# Altium schematic sheet DFMM_2024.SchDoc
size A3; SheetNumber: 1; SheetTotal: 3
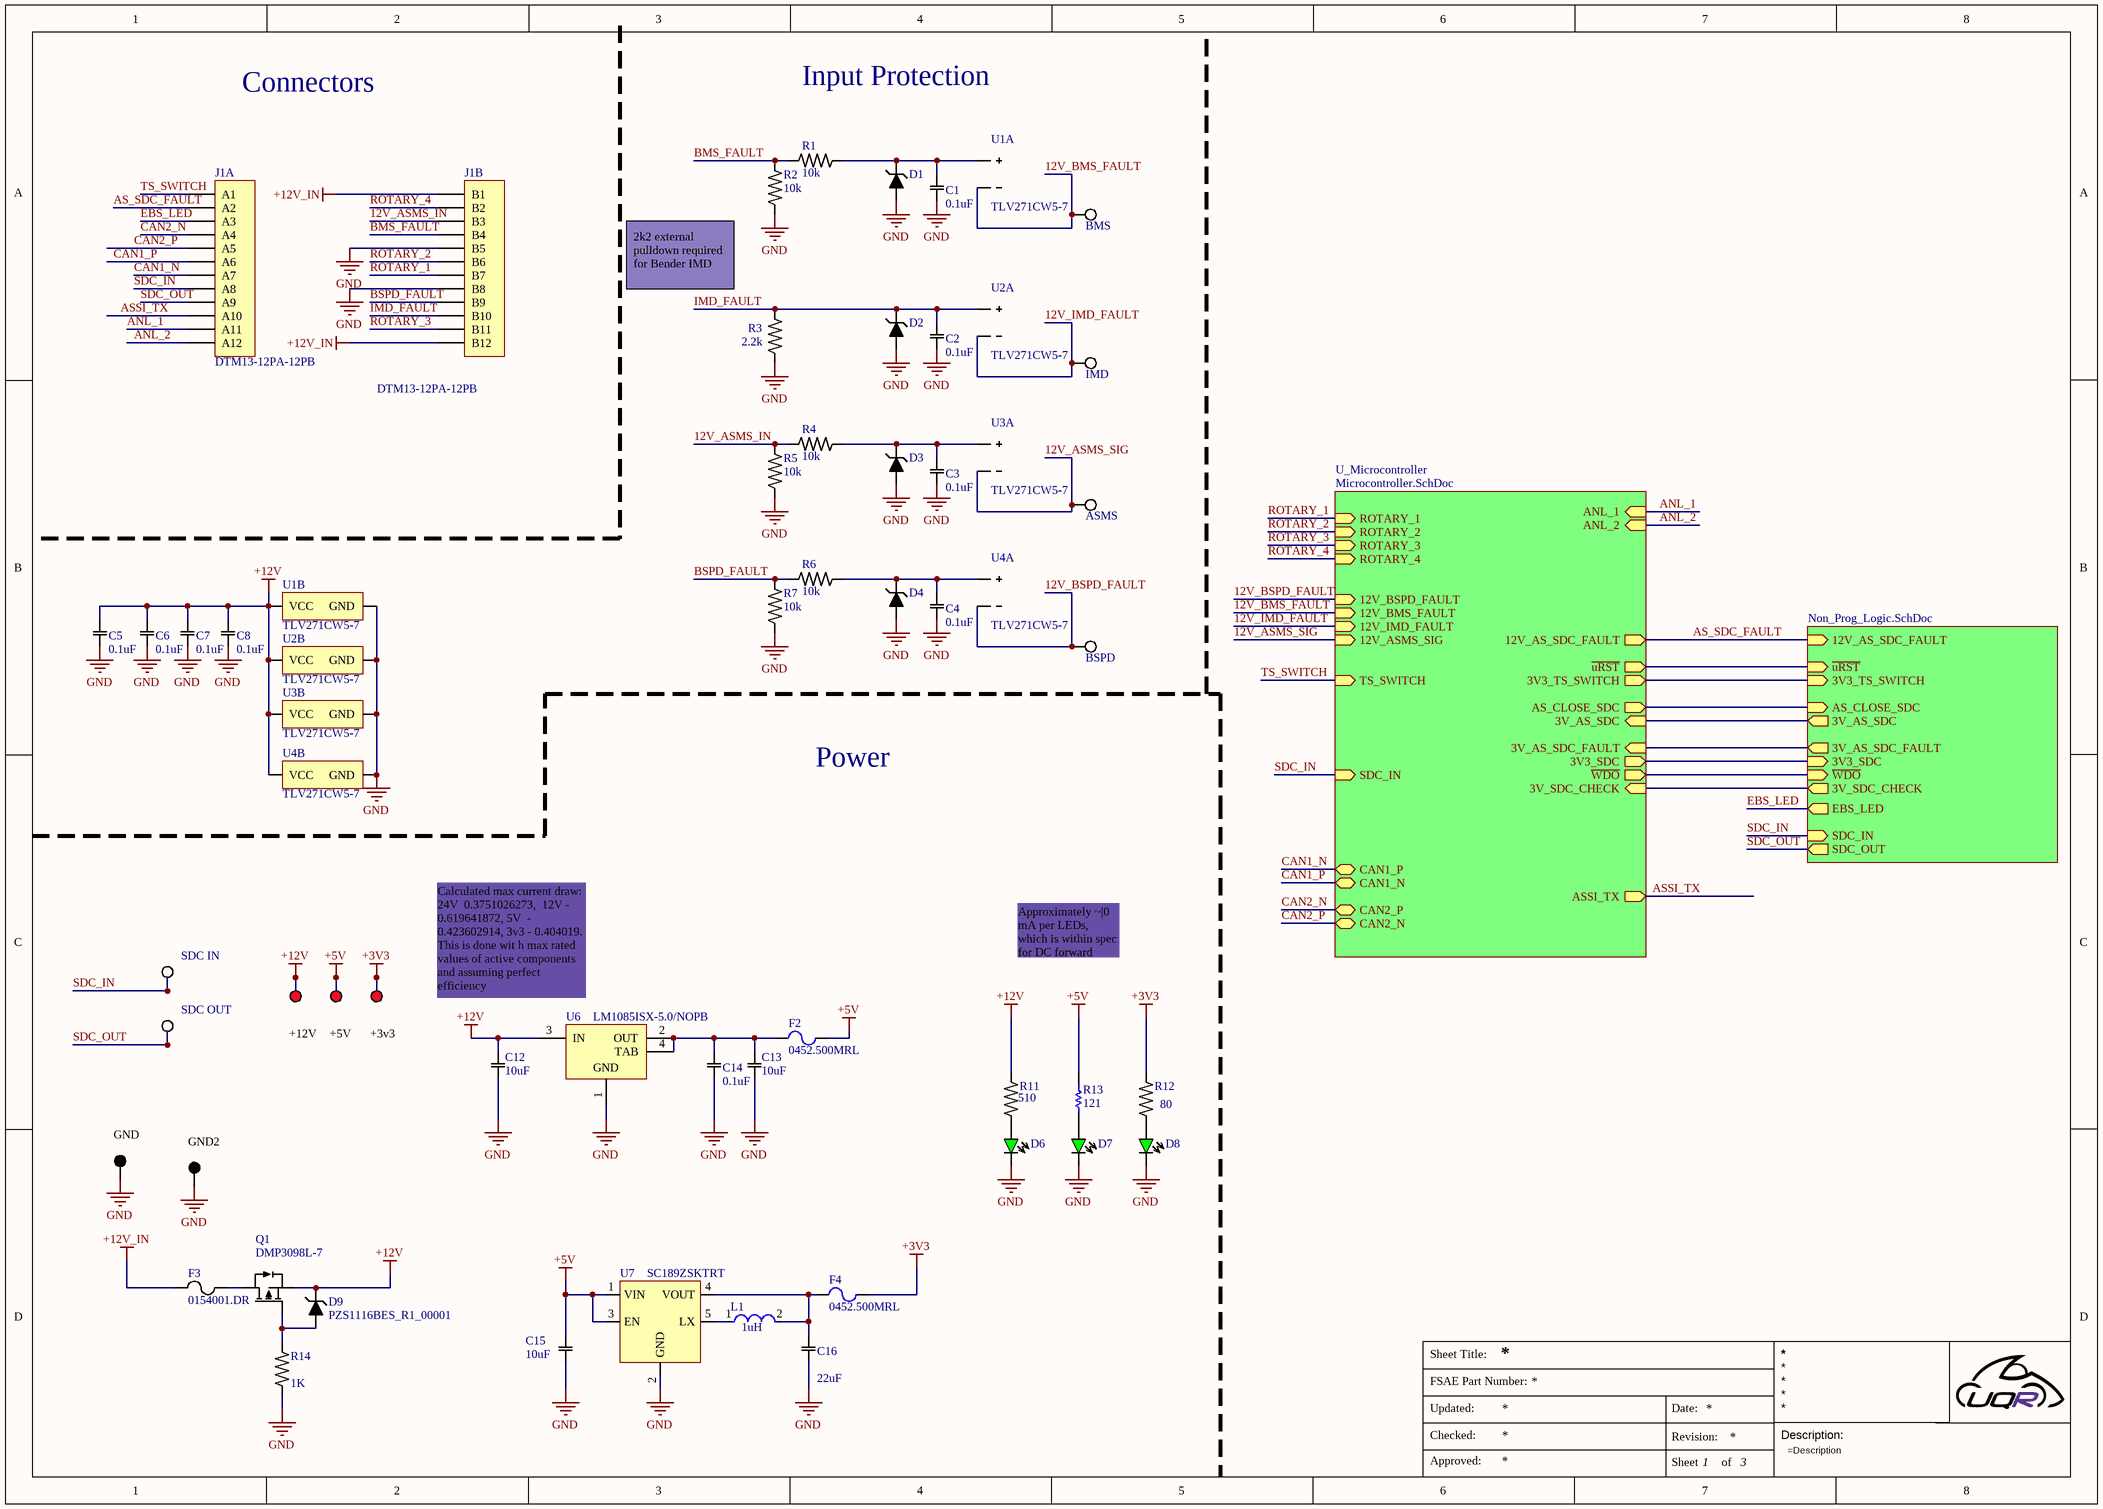
[diagram p0: DFMM_2024.SchDoc]

## Parts
+3v3  5010  [KSTN-5010_V]  (value not drawn)
+5V  5010  [KSTN-5010_V]  (value not drawn)
+12V  5010  [KSTN-5010_V]  (value not drawn)
ASMS  5012  [KSTN-5012_V]  (value not drawn)
BMS  5012  [KSTN-5012_V]  (value not drawn)
BSPD  5012  [KSTN-5012_V]  (value not drawn)
C1  value 0.1uF  [CAPC1608X09M]  (hidden comment: CL10B104KB8NNWC)
C2  value 0.1uF  [CAPC1608X09M]  (hidden comment: CL10B104KB8NNWC)
C3  value 0.1uF  [CAPC1608X09M]  (hidden comment: CL10B104KB8NNWC)
C4  value 0.1uF  [CAPC1608X09M]  (hidden comment: CL10B104KB8NNWC)
C5  value 0.1uF  [CAPC1608X09M]  (hidden comment: CL10B104KB8NNWC)
C6  value 0.1uF  [CAPC1608X09M]  (hidden comment: CL10B104KB8NNWC)
C7  value 0.1uF  [CAPC1608X09M]  (hidden comment: CL10B104KB8NNWC)
C8  value 0.1uF  [CAPC1608X09M]  (hidden comment: CL10B104KB8NNWC)
C12  value 10uF  [CAPC2012X14N]  (hidden comment: CL21A106KOQNNNE)
C13  value 10uF  [CAPC2012X14N]  (hidden comment: CL21A106KOQNNNE)
C14  value 0.1uF  [CAPC1608X09M]  (hidden comment: CL10B104KB8NNWC)
C15  value 10uF  [CAPC2012X14N]  (hidden comment: CL21A106KOQNNNE)
C16  value 22uF  [CAPC2012X14N]  (hidden comment: CL21A226MQQNNNE)
D1  PZS1116BES_R1_00001  [SODFL160X65-2N]  (value not drawn)
D2  PZS1116BES_R1_00001  [SODFL160X65-2N]  (value not drawn)
D3  PZS1116BES_R1_00001  [SODFL160X65-2N]  (value not drawn)
D4  PZS1116BES_R1_00001  [SODFL160X65-2N]  (value not drawn)
D6  LTST-C191KGKT  [LTST-C191KSKT]  (value not drawn)
D7  LTST-C191KGKT  [LTST-C191KSKT]  (value not drawn)
D8  LTST-C191KGKT  [LTST-C191KSKT]  (value not drawn)
D9  PZS1116BES_R1_00001  [SODFL160X65-2N]
F2  0452.500MRL  [LFUS-0452_V]
F3  0154001.DR  [0154001.DRFP]
F4  0452.500MRL  [LFUS-0452_V]
GND  5011  [KSTN-5011_V]  (value not drawn)
GND2  5011  [KSTN-5011_V]  (value not drawn)
IMD  5012  [KSTN-5012_V]  (value not drawn)
J1  DTM13-12PA-12PB  [DTM13-12PA-12PB-Footprint-1]  (parts A,B of 2)
L1  Inductance: 1uH  [FP-MLZ2012-0_85-IPC_B]  (hidden comment: MLP2012S1R0MT0S1)
Q1  DMP3098L-7  [SOT90P240X110-3N]
R1  value 10k  [RESC1608X06N]  (hidden comment: ESR03EZPJ103)
R2  value 10k  [RESC1608X06N]  (hidden comment: ESR03EZPJ103)
R3  value 2.2k  [RESC1608X06N]  (hidden comment: RC0603FR-072K2L)
R4  value 10k  [RESC1608X06N]  (hidden comment: ESR03EZPJ103)
R5  value 10k  [RESC1608X06N]  (hidden comment: ESR03EZPJ103)
R6  value 10k  [RESC1608X06N]  (hidden comment: ESR03EZPJ103)
R7  value 10k  [RESC1608X06N]  (hidden comment: ESR03EZPJ103)
R11  value 510  [RESC2012X06N]  (hidden comment: RC0805JR-07510RL)
R12  value 80  [RESC2012X06N]  (hidden comment: RC0805FR-0780R6L)
R13  121  [RESC1608X55X30ML15T15]
R14  value 1K  [RESC1608X06N]  (hidden comment: RNCP0603FTD1K00)
SDC_IN  5012  [KSTN-5012_V]  (value not drawn)
SDC_OUT  5012  [KSTN-5012_V]  (value not drawn)
U1  TLV271CW5-7  [SOT95P285X130-5N]  (parts A,B of 2)
U2  TLV271CW5-7  [SOT95P285X130-5N]  (parts A,B of 2)
U3  TLV271CW5-7  [SOT95P285X130-5N]  (parts A,B of 2)
U4  TLV271CW5-7  [SOT95P285X130-5N]  (parts A,B of 2)
U6  LM1085ISX-5.0/NOPB  [KTT0003B_N]
U7  SC189ZSKTRT  [SOT95P280X145-5N]

## Sub-sheets
U_Microcontroller = Microcontroller.SchDoc: ~{WDO} (out), ROTARY_2 (in), ROTARY_1 (in), ROTARY_4 (in), ROTARY_3 (in), 12V_ASMS_SIG (in), AS_CLOSE_SDC (out), TS_SWITCH (in), 3V3_TS_SWITCH (out), 12V_IMD_FAULT (in), 3V3_SDC (out), 12V_BMS_FAULT (in), 12V_BSPD_FAULT (in), SDC_IN (in), ~{uRST} (out), CAN1_P (bidir), CAN1_N (bidir), CAN2_P (bidir), CAN2_N (bidir), ANL_1 (in), ANL_2 (in), 12V_AS_SDC_FAULT (out), 3V_AS_SDC_FAULT (in), 3V_AS_SDC (in), 3V_SDC_CHECK (in), ASSI_TX (out)
U_Non_Prog_Logic = Non_Prog_Logic.SchDoc: 3V3_TS_SWITCH (in), 3V_AS_SDC (out), 3V3_SDC (in), ~{WDO} (in), AS_CLOSE_SDC (in), SDC_IN (in), SDC_OUT (out), ~{uRST} (in), 3V_SDC_CHECK (out), 3V_AS_SDC_FAULT (out), 12V_AS_SDC_FAULT (in), EBS_LED (out)

## Nets
+3V3: +3v3.1 F4.2 R12.2
+5V: +5V.1 C15.1 F2.2 R13.1 U7.1(VIN) U7.3(EN)
+12V: +12V.1 C5.2 C6.2 C7.2 C8.2 C12.1 D9.1(K) Q1.2(S) R11.2 U1.5(VCC) U2.5(VCC) U3.5(VCC) U4.5(VCC) U6.3(IN)
+12V_IN: F3.1 J1.B1 J1.B12
GND: C1.1 C2.1 C3.1 C4.1 C5.1 C6.1 C7.1 C8.1 C12.2 C13.2 C14.1 C15.2 C16.2 D1.2(A) D2.2(A) D3.2(A) D4.2(A) D6.2(K) D7.2(K) D8.2(K) GND.1 GND2.1 J1.B5 J1.B8 R2.1 R3.1 R5.1 R7.1 R14.1 U1.2(GND) U2.2(GND) U3.2(GND) U4.2(GND) U6.1(GND) U7.2(GND)
12V_ASMS_IN: J1.B3 R4.1 R5.2
12V_ASMS_SIG: ASMS.1 U3.1(OUT) U3.4(IN-) ; sheet U_Microcontroller/12V_ASMS_SIG
12V_BMS_FAULT: BMS.1 U1.1(OUT) U1.4(IN-) ; sheet U_Microcontroller/12V_BMS_FAULT
12V_BSPD_FAULT: BSPD.1 U4.1(OUT) U4.4(IN-) ; sheet U_Microcontroller/12V_BSPD_FAULT
12V_IMD_FAULT: IMD.1 U2.1(OUT) U2.4(IN-) ; sheet U_Microcontroller/12V_IMD_FAULT
ANL_1: J1.A11 ; sheet U_Microcontroller/ANL_1
ANL_2: J1.A12 ; sheet U_Microcontroller/ANL_2
AS_SDC_FAULT: J1.A2 ; sheet U_Non_Prog_Logic/12V_AS_SDC_FAULT, sheet U_Microcontroller/12V_AS_SDC_FAULT
ASSI_TX: J1.A10 ; sheet U_Microcontroller/ASSI_TX
BMS_FAULT: J1.B4 R1.1 R2.2
BSPD_FAULT: J1.B9 R6.1 R7.2
CAN1_N: J1.A7 ; sheet U_Microcontroller/CAN1_P
CAN1_P: J1.A6 ; sheet U_Microcontroller/CAN1_N
CAN2_N: J1.A4 ; sheet U_Microcontroller/CAN2_P
CAN2_P: J1.A5 ; sheet U_Microcontroller/CAN2_N
EBS_LED: J1.A3 ; sheet U_Non_Prog_Logic/EBS_LED
IMD_FAULT: C2.2 D2.1(K) J1.B10 R3.2 U2.3(IN+)
ROTARY_1: J1.B7 ; sheet U_Microcontroller/ROTARY_1
ROTARY_2: J1.B6 ; sheet U_Microcontroller/ROTARY_2
ROTARY_3: J1.B11 ; sheet U_Microcontroller/ROTARY_3
ROTARY_4: J1.B2 ; sheet U_Microcontroller/ROTARY_4
SDC_IN: J1.A8 SDC_IN.1 ; sheet U_Non_Prog_Logic/SDC_IN, sheet U_Microcontroller/SDC_IN
SDC_OUT: J1.A9 SDC_OUT.1 ; sheet U_Non_Prog_Logic/SDC_OUT
TS_SWITCH: J1.A1 ; sheet U_Microcontroller/TS_SWITCH
NetC1_2: C1.2 D1.1(K) R1.2 U1.3(IN+)
NetC3_2: C3.2 D3.1(K) R4.2 U3.3(IN+)
NetC4_2: C4.2 D4.1(K) R6.2 U4.3(IN+)
NetC13_1: C13.1 C14.2 F2.1 U6.2(OUT) U6.4(TAB)
NetC16_1: C16.1 F4.1 L1.2 U7.4(VOUT)
NetD6_1: D6.1(A) R11.1
NetD7_1: D7.1(A) R13.2
NetD8_1: D8.1(A) R12.1
NetD9_2: D9.2(A) Q1.1(G) R14.2
NetF3_2: F3.2 Q1.3(D)
NetL1_1: L1.1 U7.5(LX)
(unnamed): sheet U_Non_Prog_Logic/3V3_TS_SWITCH, sheet U_Microcontroller/3V3_TS_SWITCH
(unnamed): sheet U_Non_Prog_Logic/3V_AS_SDC, sheet U_Microcontroller/3V_AS_SDC
(unnamed): sheet U_Non_Prog_Logic/3V3_SDC, sheet U_Microcontroller/3V3_SDC
(unnamed): sheet U_Non_Prog_Logic/~{WDO}, sheet U_Microcontroller/~{WDO}
(unnamed): sheet U_Non_Prog_Logic/AS_CLOSE_SDC, sheet U_Microcontroller/AS_CLOSE_SDC
(unnamed): sheet U_Non_Prog_Logic/~{uRST}, sheet U_Microcontroller/~{uRST}
(unnamed): sheet U_Non_Prog_Logic/3V_SDC_CHECK, sheet U_Microcontroller/3V_SDC_CHECK
(unnamed): sheet U_Non_Prog_Logic/3V_AS_SDC_FAULT, sheet U_Microcontroller/3V_AS_SDC_FAULT

## Notes on the sheet
- Connectors
- Input Protection
- 2k2 external pulldown required for Bender IMD
- Power
- Calculated max current draw: 24V  0.3751026273,  12V - 0.619641872, 5V  - 0.423602914, 3v3 - 0.404019. This is done wit h max rated values of active components and assuming perfect efficiency
- Approximately ~20 mA per LEDs, which is within spec for DC forward current
- Sheet Title:
- FSAE Part Number:
- Updated:
- Approved:
- Checked:
- Date:
- Revision:
- Description:
- Sheet
- of

## Library data of the parts
+3v3 +5V +12V = CMP-008-000005-1: PC TEST POINT MULTIPURPOSE RED; Manufacturer: Keystone Electronics; SPN: 36-5010-ND; Supplier: Digi-Key; Link: https://www.digikey.com.au/en/products/detail/keystone-electronics/5010/255332; MPN: 5010
ASMS BMS BSPD IMD SDC_IN SDC_OUT = CMP-008-000006-1: PC TEST POINT MULTIPURPOSE WHITE; Manufacturer: Keystone Electronics; SPN: 36-5012-ND; Supplier: Digi=Key; Link: https://www.digikey.com.au/en/products/detail/keystone-electronics/5012/255334; MPN: 5012
C1-C8 C14 = CMP-001-00001-2: CAP CER 0.1UF 50V X7R 0603; Manufacturer: Samsung Electro-Mechanics; SPN: 1276-1935-1-ND; Link: https://www.digikey.com.au/en/products/detail/samsung-electro-mechanics/CL10B104KB8NNWC/3887593; Supplier: Digi-Key; MPN: CL10B104KB8NNWC
C12 C13 C15 = CMP-00018-1: CAP CER 10UF 16V X5R 0805; Manufacturer: Samsung Electro-Mechanics; SPN: 1276-1096-1-ND; MPN: CL21A106KOQNNNE; Supplier: Digi-Key
C16 = CMP-001-00004-1: CAP CER 22UF 6.3V X5R 0805 / Cap Ceramic 22uF 6.3V X5R 20% Pad SMD 0805 85¡ãC T/R; Manufacturer: Samsung Electro-Mechanics; SPN: 1276-1096-1-ND; Voltage Rating (DC): 6.3V; Link: https://www.digikey.com.au/en/products/detail/samsung-electro-mechanics/CL21A106KOQNNNE/3886754?s=N4IgTCBcDaIIxgOwDYC0cAMBONdUDkAREAXQF8g; Tolerance: 20%; MPN: CL21A106KOQNNNE; Supplier: Digi-Key; Lead Free: Lead Free; Dielectric: X5R; Case/Package: 0805
D1-D4 D9 = CMP-004-00000-1: Zener Diode 16 V 150 mW ±5% Surface Mount SOD-523; Manufacturer: Panjit International Inc.; SPN: 3757-PZS1116BES_R1_00001CT-ND; Link: https://www.digikey.com.au/en/products/detail/panjit-international-inc/PZS1116BES-R1-00001/15800333; MPN: PZS1116BES_R1_00001; Supplier: Digi-Key
D6-D8 = CMP-00024-3: LED GREEN CLEAR SMD; Manufacturer: Lite-On Inc.; SPN: 160-1446-1-ND; MPN: LTST-C191KGKT; Link: https://www.digikey.com.au/en/products/detail/liteon/LTST-C191KGKT/386835; Supplier: Digi-Key
F2 F4 = CMP-2000-05698-1: NANO2(R) Slo-Blo(R) Fuse, 0.5 A, 125 V, -55 to 125 degC, 2-Pin SMD, RoHS, Tape and Reel; Manufacturer: Littelfuse; Current Rating: 0.5A; Working Voltage-Max: 125V; Manufacturer URL: http://www.littelfuse.com/; Operating Temp Range: -55to+125°C; Package Reference: 0452; Mounting Technology: SurfaceMount; Datasheet Version: 07/2015; Response Characteristic: Slo-Blo; Datasheet URL: http://download.siliconexpert.com/pdfs/2015/7/2/10/39/10/885/ltf_/manual/4322647674859060843226474844920160littelfuse_fuse_452_454_datasheet.pdf.pdf.pdf; Size: 6.10x2.69mm; Package Description: 2-Pin Surface Mount Device, Body 6.1 x 2.69 mm
F3 = CMP-00032-2: FUSE BRD MNT 1A 125VAC/VDC 2SMD; Manufacturer: Littelfuse Inc.; SPN: F1222CT-ND; Supplier: Digi-Key; Link: https://www.digikey.com.au/en/products/detail/littelfuse-inc/0154001-DR/183352; MPN: 0154001.DR
GND GND2 = CMP-008-000003-1: PC TEST POINT MULTIPURPOSE BLACK; Manufacturer: Keystone Electronics; SPN: 36-5011-ND; Supplier: Digi-Key; Link: https://www.digikey.com.au/en/products/detail/keystone-electronics/5011/255333; MPN: 5011
J1 = CMP-00014-1: CONN HEADER R/A 24POS; Manufacturer: TE Connectivity Deutsch Connectors; MPN: DTM13-12PA-12PB-R008; SPN: 1734-1131-ND; Link: https://www.digikey.com.au/en/products/detail/te-connectivity-deutsch-ict-connectors/DTM13-12PA-12PB-R008/6566695?s=N4IgTCBcDaICIBUCyBGAzAWhWACgQS1wCEQBdAXyA; Supplier: Digi-Key
L1 = CMP-00056-2: Power Inductors - SMD 2mm x 1.25mm x 0.85mm, -40 to +125 degC, 1000mA, 1uH, 208mO; Manufacturer: TDK; SPN: 810-MLP2012S1R0MT0S1; Supplier: Mouser; Link: https://au.mouser.com/ProductDetail/TDK/MLP2012S1R0MT0S1?qs=%2FPzWLGNeQ%252Bg5lqpZ20rIgw%3D%3D; MPN: MLP2012S1R0MT0S1
Q1 = CMP-013-00001-1: MOSFET P-CH 30V 3.8A SOT23-3; Manufacturer: Diodes Incorporated; SPN: DMP3098LDICT-ND; MPN: DMP3098L-7; Supplier: Digi-Key; Link: https://www.digikey.com.au/en/products/detail/diodes-incorporated/DMP3098L-7/1964699
R1 R2 R4-R7 = CMP-00017-5: RES SMD 10K OHM 5% 1/4W 0603; Manufacturer: Rohm Semiconductor; SPN: RHM10KDCT-ND; Supplier: Digi-Key; Link: https://www.digikey.com.au/en/products/detail/rohm-semiconductor/ESR03EZPJ103/1762722; MPN: ESR03EZPJ103
R3 = CMP-009-00004-2: RES 2.2K OHM 1% 1/10W 0603; Manufacturer: YAGEO; SPN: 311-2.20KHRCT-ND; MPN: RC0603FR-072K2L; Supplier: Digi-Key; Link: https://www.digikey.com.au/en/products/detail/yageo/RC0603FR-072K2L/727016
R11 = CMP-009-00008-1: RES 510 OHM 5% 1/8W 0805; Manufacturer: YAGEO; SPN: 311-510ARCT-ND; Supplier: Digi-Key; Link: https://www.digikey.com.au/en/products/detail/yageo/RC0805JR-07510RL/728343; MPN: RC0805JR-07510RL
R12 = CMP-009-00015-1: Res Thick Film 0805 80.6 Ohm 1% 1/8W ±100ppm/°C Molded SMD SMD Paper T/R; Manufacturer: YAGEO; Power Rating: 125mW; Voltage Rating (DC): 150V; SPN: 311-200CRCT-ND; RoHS Compliant: Yes; Min Operating Temperature: -55°C; Number of Terminations: 2; Case Code (Metric): 2012; Max Power Dissipation: 125mW; Length: 0.079inch; Series: RC; Packaging: Tape and Reel; Tolerance: 1%; Features: Moisture Resistant; Height: 0.024inch; Case Code (Imperial): 0805; Voltage Rating: 150V; Lead Free: Lead Free; Contact Plating: Tin,Matte; Max Operating Temperature: 155°C; Width: 0.049inch; Case/Package: 0805; Package Quantity: 1; Termination: SMD/SMT; Temperature Coefficient: 100ppm/°C; MPN: RC0805FR-07200RL; Supplier: Digi-Key; Link: https://www.digikey.com.au/en/products/detail/yageo/RC0805FR-07200RL/727723
R13 = CMP-2005-01727-1: Manufacturer: Yageo; Part Number: RC1210JR-07150RL
R14 = CMP-009-00002-2: RES 1K OHM 1% 1/8W 0603; Manufacturer: Stackpole Electronics Inc; SPN: RNCP0603FTD1K00CT-ND; MPN: RNCP0603FTD1K00; Link: https://www.digikey.com.au/en/products/detail/stackpole-electronics-inc/RNCP0603FTD1K00/2240106; Supplier: Digi-Key
U1-U4 = CMP-001-0003-1: IC CMOS 1 CIRCUIT SOT25; Manufacturer: Diodes Incorporated; SPN: TLV271CW5-7DICT-ND; MPN: TLV271CW5-7; Link: https://www.digikey.com.au/en/products/detail/diodes-incorporated/TLV271CW5-7/4747689; Supplier: Digi-Key
U6 = CMP-00055-1: Linear Voltage Regulator IC Positive Fixed 1 Output 5V 3A DDPAK/TO-263-3; Manufacturer: Texas Instruments; SPN: 926-LM1085ISX50NOPB; MPN: LM1085ISX-5.0/NOPB; Supplier: Mouser; Link: https://au.mouser.com/ProductDetail/Texas-Instruments/LM1085ISX-5.0-NOPB?qs=X1J7HmVL2ZHFZAya9Kdzeg%3D%3D
U7 = CMP-00039-6: SC189 Series 5.5 V 3 MHz 1.5 A 1Buck Surface Mount Switching Regulator - SOT-23; Maunfacturer: Semtech; SPN: 947-SC189ZSKTRT; Supplier: Mouser; MPN: SC189ZSKTRT; Link: https://au.mouser.com/ProductDetail/Semtech/SC189ZSKTRT?qs=rBWM4%252BvDhIck0D%2FgoUNMIQ%3D%3D